# Altium schematic sheet DSP_interconnect.SchDoc: Наименование
size 420 x 297 mm; ApprovedBy: Утвердил; CheckedBy: Проверил; Author: Разработал; CompanyName: ВлГУ; DrawnBy: Н.Контр; Engineer: Т.Контр; SheetNumber: 4; SheetTotal: 9; PageSetup: Record=PageOptions|CenterHorizontal=True|CenterVertical=True|PrintScale=0.94|XCorrection=1.00|YCorrection=1.00|PrintKind=1|BorderSize=5000000|LeftOffset=0|BottomOffset=0|Orientation=1|PaperLength=1000|PaperWidth=1000|Scale=100|PaperSource=7|PrintQuality=-4|MediaType=1|DitherType=10|PaperKind=A4|PrintScaleMode=1; DecimalNumber: Децимальный номер; HeadOfSector: Нач. сектора; MainDevice: Перв.примен.; Name: Наименование; DocumentName: Sheet1.SCHDOC
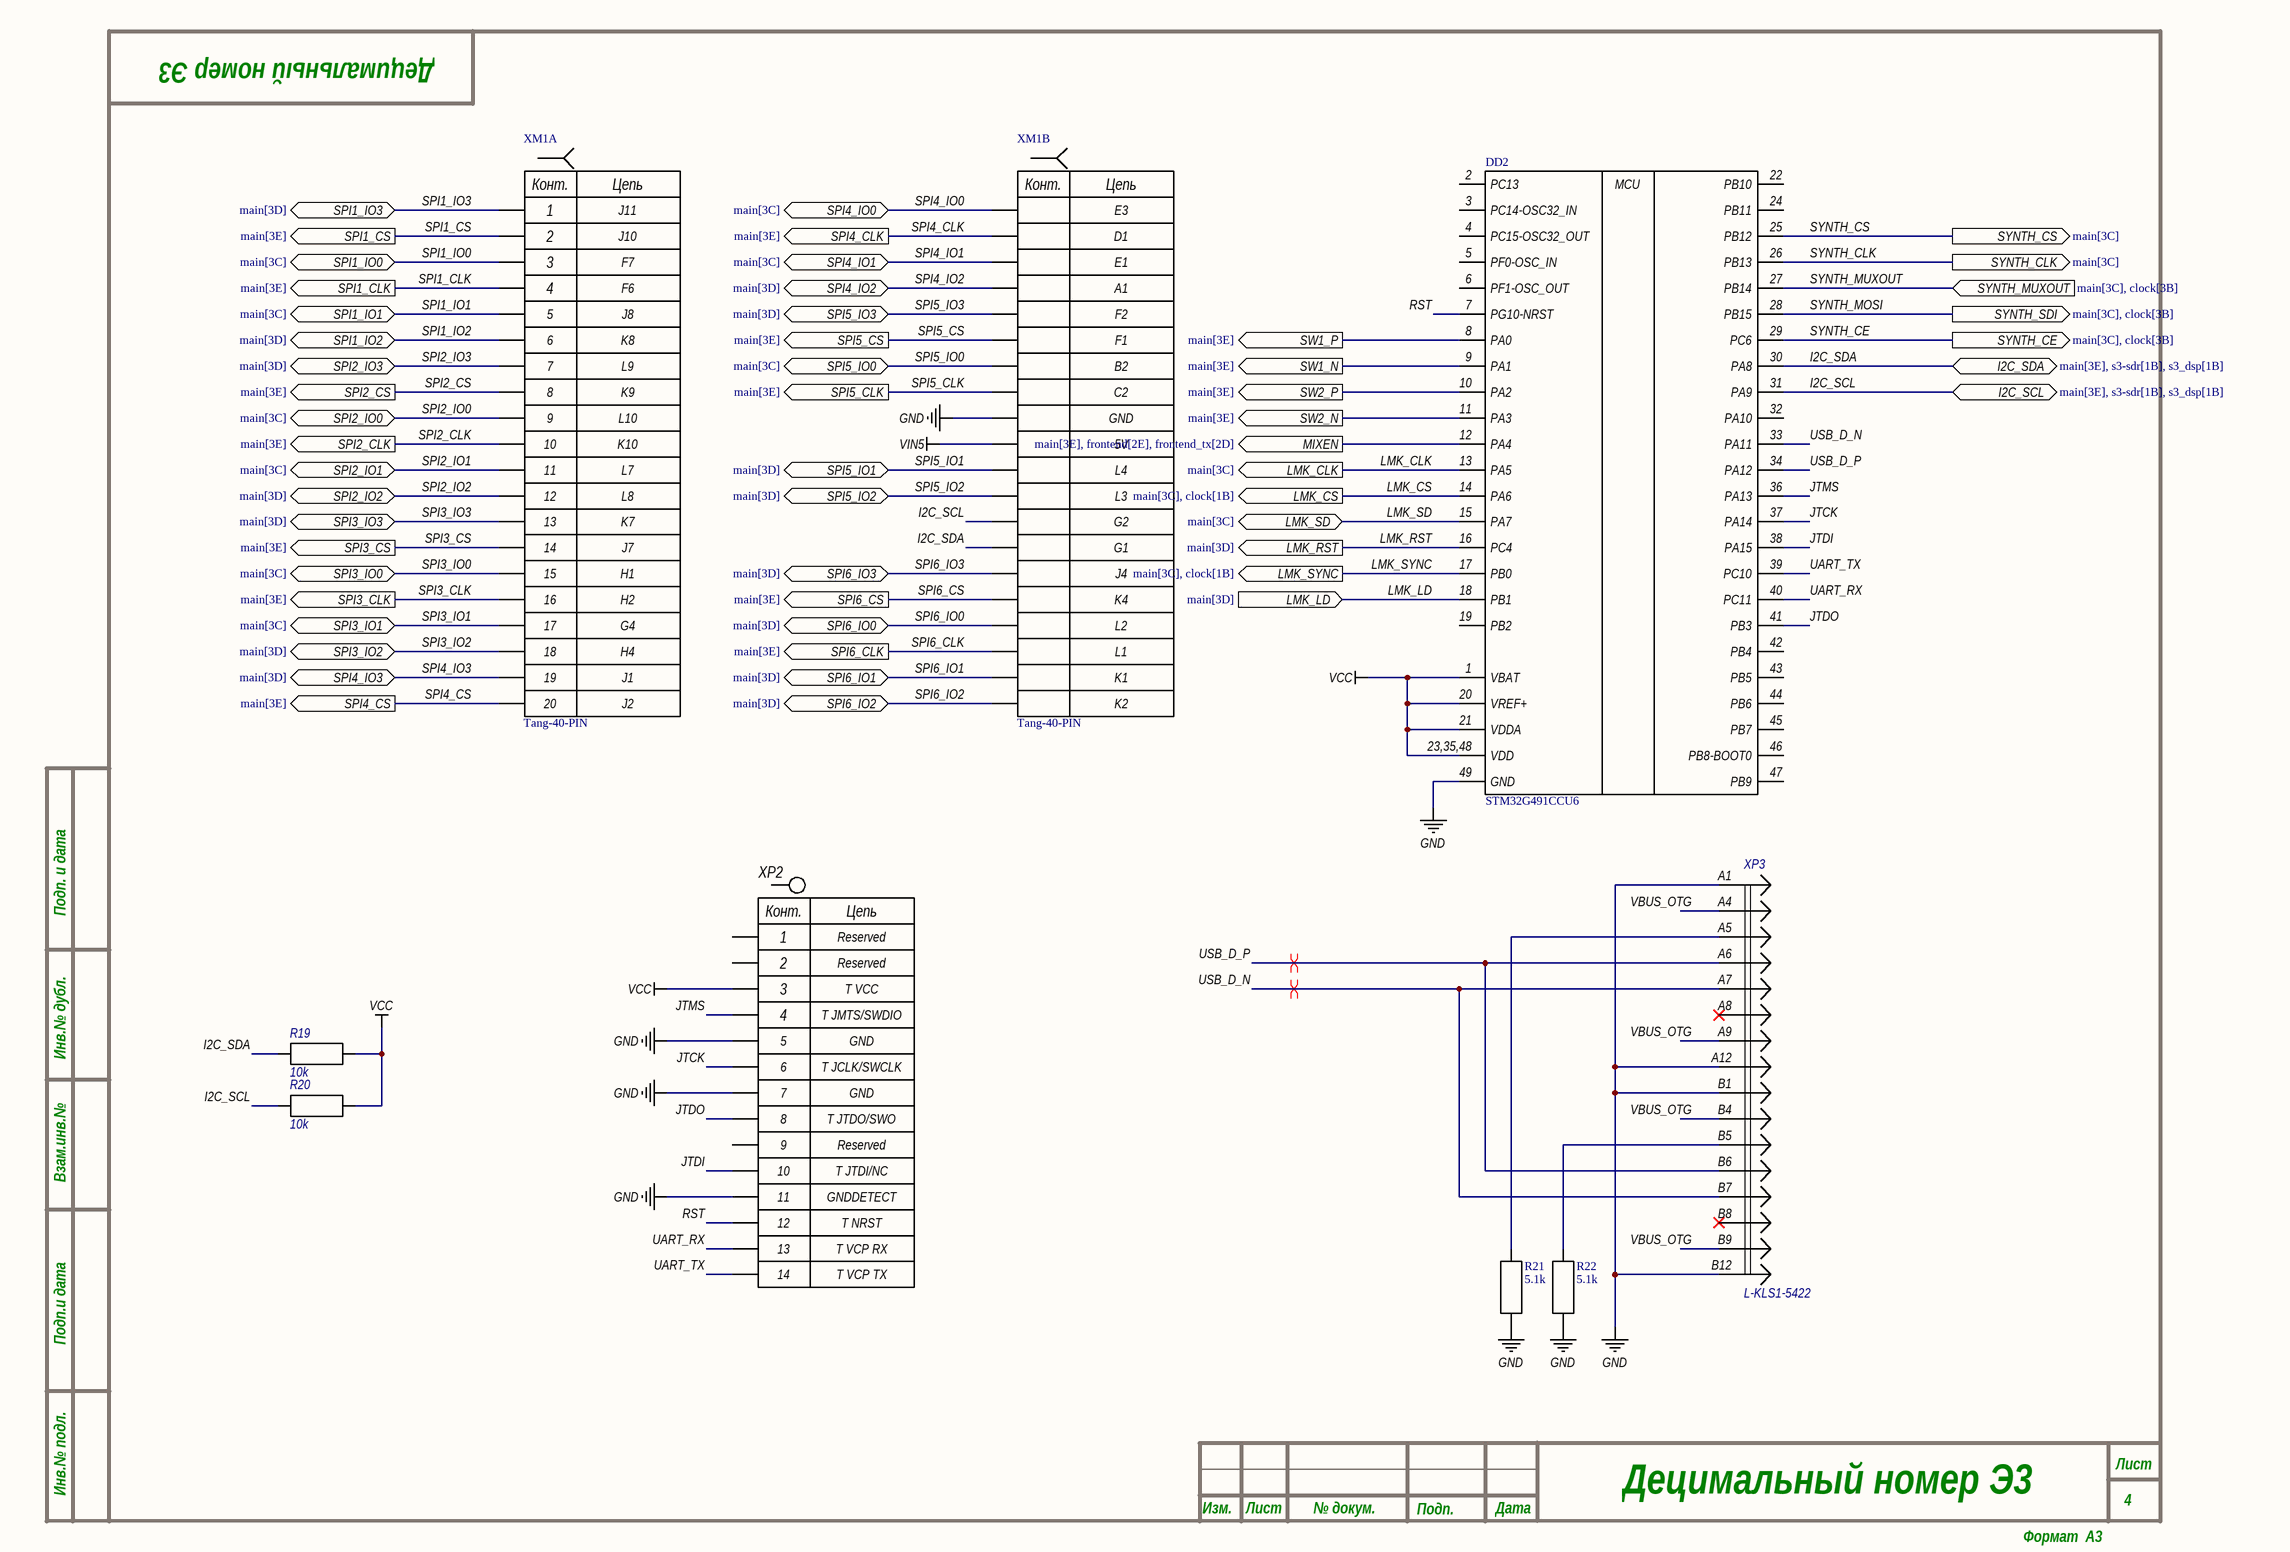
[diagram p0: DSP_interconnect.SchDoc]

## Parts
DD2  STM32G491CCU6  [QFN48]
R19  10k  [C0805R]
R20  10k  [C0805R]
R21  5.1k  [C0805R]
R22  5.1k  [C0805R]
XM1  Tang-40-PIN  [TANG-40PIN]  (parts A,B of 2)
XP2  ConnectorPin-6_Table  [PLLD-1.27-14S]  (value not drawn)
XP3  L-KLS1-5422  [L-KLS1-5422]

## Ports
I2C_SCL (bidir, see main[3E], s3-sdr[1B], s3_dsp[1B]), I2C_SDA (bidir, see main[3E], s3-sdr[1B], s3_dsp[1B]), LMK_CLK (out, see main[3C]), LMK_CS (out, see main[3C], clock[1B]), LMK_LD (in, see main[3D]), LMK_RST (out, see main[3D]), LMK_SD (bidir, see main[3C]), LMK_SYNC (out, see main[3C], clock[1B]), MIXEN (out, see main[3E], frontend[2E], frontend_tx[2D]), SPI1_CLK (out, see main[3E]), SPI1_CS (out, see main[3E]), SPI1_IO0 (bidir, see main[3C]), SPI1_IO1 (bidir, see main[3C]), SPI1_IO2 (bidir, see main[3D]), SPI1_IO3 (bidir, see main[3D]), SPI2_CLK (out, see main[3E]), SPI2_CS (out, see main[3E]), SPI2_IO0 (bidir, see main[3C]), SPI2_IO1 (bidir, see main[3C]), SPI2_IO2 (bidir, see main[3D]), SPI2_IO3 (bidir, see main[3D]), SPI3_CLK (out, see main[3E]), SPI3_CS (out, see main[3E]), SPI3_IO0 (bidir, see main[3C]), SPI3_IO1 (bidir, see main[3C]), SPI3_IO2 (bidir, see main[3D]), SPI3_IO3 (bidir, see main[3D]), SPI4_CLK (out, see main[3E]), SPI4_CS (out, see main[3E]), SPI4_IO0 (bidir, see main[3C]), SPI4_IO1 (bidir, see main[3C]), SPI4_IO2 (bidir, see main[3D]), SPI4_IO3 (bidir, see main[3D]), SPI5_CLK (out, see main[3E]), SPI5_CS (out, see main[3E]), SPI5_IO0 (bidir, see main[3C]), SPI5_IO1 (bidir, see main[3D]), SPI5_IO2 (bidir, see main[3D]), SPI5_IO3 (bidir, see main[3D]), SPI6_CLK (out, see main[3E]), SPI6_CS (out, see main[3E]), SPI6_IO0 (bidir, see main[3D]), SPI6_IO1 (bidir, see main[3D]), SPI6_IO2 (bidir, see main[3D]), SPI6_IO3 (bidir, see main[3D]), SW1_N (out, see main[3E]), SW1_P (out, see main[3E]), SW2_N (out, see main[3E]), SW2_P (out, see main[3E]), SYNTH_CE (out, see main[3C], clock[3B]), SYNTH_CLK (out, see main[3C]), SYNTH_CS (out, see main[3C]), SYNTH_MUXOUT (in, see main[3C], clock[3B]), SYNTH_SDI (out, see main[3C], clock[3B])

## Nets
GND: DD2.49(GND) R21.2 R22.2 XM1.29 XP2.5 XP2.7 XP2.11 XP3.A1 XP3.A12 XP3.B1 XP3.B12
VCC: DD2.1(VBAT) DD2.20(VREF+) DD2.21(VDDA) DD2.23,35,48(VDD) R19.2 R20.2 XP2.3
VIN5: XM1.30
I2C_SCL: DD2.31(PA9) R20.1 XM1.33 ; port I2C_SCL
I2C_SDA: DD2.30(PA8) R19.1 XM1.34 ; port I2C_SDA
JTCK: DD2.37(PA14) XP2.6
JTDI: DD2.38(PA15) XP2.10
JTDO: DD2.41(PB3) XP2.8
JTMS: DD2.36(PA13) XP2.4
LMK_CLK: DD2.13(PA5) ; port LMK_CLK
LMK_CS: DD2.14(PA6) ; port LMK_CS
LMK_LD: DD2.18(PB1) ; port LMK_LD
LMK_RST: DD2.16(PC4) ; port LMK_RST
LMK_SD: DD2.15(PA7) ; port LMK_SD
LMK_SYNC: DD2.17(PB0) ; port LMK_SYNC
MIXEN: DD2.12(PA4) ; port MIXEN
RST: DD2.7(PG10-NRST) XP2.12
SPI1_CLK: XM1.4 ; port SPI1_CLK
SPI1_CS: XM1.2 ; port SPI1_CS
SPI1_IO0: XM1.3 ; port SPI1_IO0
SPI1_IO1: XM1.5 ; port SPI1_IO1
SPI1_IO2: XM1.6 ; port SPI1_IO2
SPI1_IO3: XM1.1 ; port SPI1_IO3
SPI2_CLK: XM1.10 ; port SPI2_CLK
SPI2_CS: XM1.8 ; port SPI2_CS
SPI2_IO0: XM1.9 ; port SPI2_IO0
SPI2_IO1: XM1.11 ; port SPI2_IO1
SPI2_IO2: XM1.12 ; port SPI2_IO2
SPI2_IO3: XM1.7 ; port SPI2_IO3
SPI3_CLK: XM1.16 ; port SPI3_CLK
SPI3_CS: XM1.14 ; port SPI3_CS
SPI3_IO0: XM1.15 ; port SPI3_IO0
SPI3_IO1: XM1.17 ; port SPI3_IO1
SPI3_IO2: XM1.18 ; port SPI3_IO2
SPI3_IO3: XM1.13 ; port SPI3_IO3
SPI4_CLK: XM1.22 ; port SPI4_CLK
SPI4_CS: XM1.20 ; port SPI4_CS
SPI4_IO0: XM1.21 ; port SPI4_IO0
SPI4_IO1: XM1.23 ; port SPI4_IO1
SPI4_IO2: XM1.24 ; port SPI4_IO2
SPI4_IO3: XM1.19 ; port SPI4_IO3
SPI5_CLK: XM1.28 ; port SPI5_CLK
SPI5_CS: XM1.26 ; port SPI5_CS
SPI5_IO0: XM1.27 ; port SPI5_IO0
SPI5_IO1: XM1.31 ; port SPI5_IO1
SPI5_IO2: XM1.32 ; port SPI5_IO2
SPI5_IO3: XM1.25 ; port SPI5_IO3
SPI6_CLK: XM1.38 ; port SPI6_CLK
SPI6_CS: XM1.36 ; port SPI6_CS
SPI6_IO0: XM1.37 ; port SPI6_IO0
SPI6_IO1: XM1.39 ; port SPI6_IO1
SPI6_IO2: XM1.40 ; port SPI6_IO2
SPI6_IO3: XM1.35 ; port SPI6_IO3
SW1_N: DD2.9(PA1) ; port SW1_N
SW1_P: DD2.8(PA0) ; port SW1_P
SW2_N: DD2.11(PA3) ; port SW2_N
SW2_P: DD2.10(PA2) ; port SW2_P
SYNTH_CE: DD2.29(PC6) ; port SYNTH_CE
SYNTH_CLK: DD2.26(PB13) ; port SYNTH_CLK
SYNTH_CS: DD2.25(PB12) ; port SYNTH_CS
SYNTH_MOSI: DD2.28(PB15) ; port SYNTH_SDI
SYNTH_MUXOUT: DD2.27(PB14) ; port SYNTH_MUXOUT
UART_RX: DD2.40(PC11) XP2.13
UART_TX: DD2.39(PC10) XP2.14
USB_D_N: DD2.33(PA11) XP3.A7 XP3.B7
USB_D_P: DD2.34(PA12) XP3.A6 XP3.B6
VBUS_OTG: XP3.A4 XP3.A9 XP3.B4 XP3.B9
NetR21_1: R21.1 XP3.A5
NetR22_1: R22.1 XP3.B5

Not connected (* = marked no-connect by the designer): DD2 2(PC13) 3(PC14-OSC32_IN) 4(PC15-OSC32_OUT) 5(PF0-OSC_IN) 6(PF1-OSC_OUT) 19(PB2) 22(PB10) 24(PB11) 32(PA10) 42(PB4) 43(PB5) 44(PB6) 45(PB7) 46(PB8-BOOT0) 47(PB9); XP2 1 2 9; XP3 A8* B8*

## Layout directives
differential pair: USB_D_N, USB_D_P

## Notes on the sheet
- Подп. и дата
- Инв.№ дубл.
- Взам.инв.№
- Подп.и дата
- Инв.№ подл.
- Изм.
- Лист
- № докум.
- Подп.
- Дата
- Формат  A3
- (in symbol STDC-14) Конт.; Цепь; Reserved; T VCC; T JMTS/SWDIO; GND; T JCLK/SWCLK; T JTDO/SWO; T JTDI/NC; GNDDETECT; T NRST; T VCP RX; T VCP TX
- (in symbol STM32G491CCU6) MCU
- (in symbol Tang-40-PIN, part A) Конт.; Цепь; J11; J10; F7; F6; J8; K8; L9; K9; L10; K10; L7; L8; K7; J7; H1; H2; G4; H4; J1; J2
- (in symbol Tang-40-PIN, part B) Конт.; Цепь; E3; D1; E1; A1; F2; F1; B2; C2; GND; 5V; L4; L3; G2; G1; J4; K4; L2; L1; K1; K2

## Library data of the parts
DD2 = STM32G491CCU6: Mainstream Arm Cortex-M4 MCU 170 MHz with 256 Kbytes of Flash memory, Math Accelerator, High Analog level integration
R19 R20 = res: Value: 10k
R21 R22 = res: MAPPING: 2(1,2,100)(1,2,100); Value: 5.1k; TYPE: Resistor
XP2 = STDC-14
XP3 = L-KLS1-5422: Стандарт USB 3.1 , Тип стандарта Type C , Монтаж На плату, SMD , Тип разъема Розетка , Количество портов 1 , Расположение контактов Прямое; Part number: L-KLS1-5422